# Altium schematic sheet MCU.SchDoc
size A4; SheetNumber: 3; SheetTotal: 7
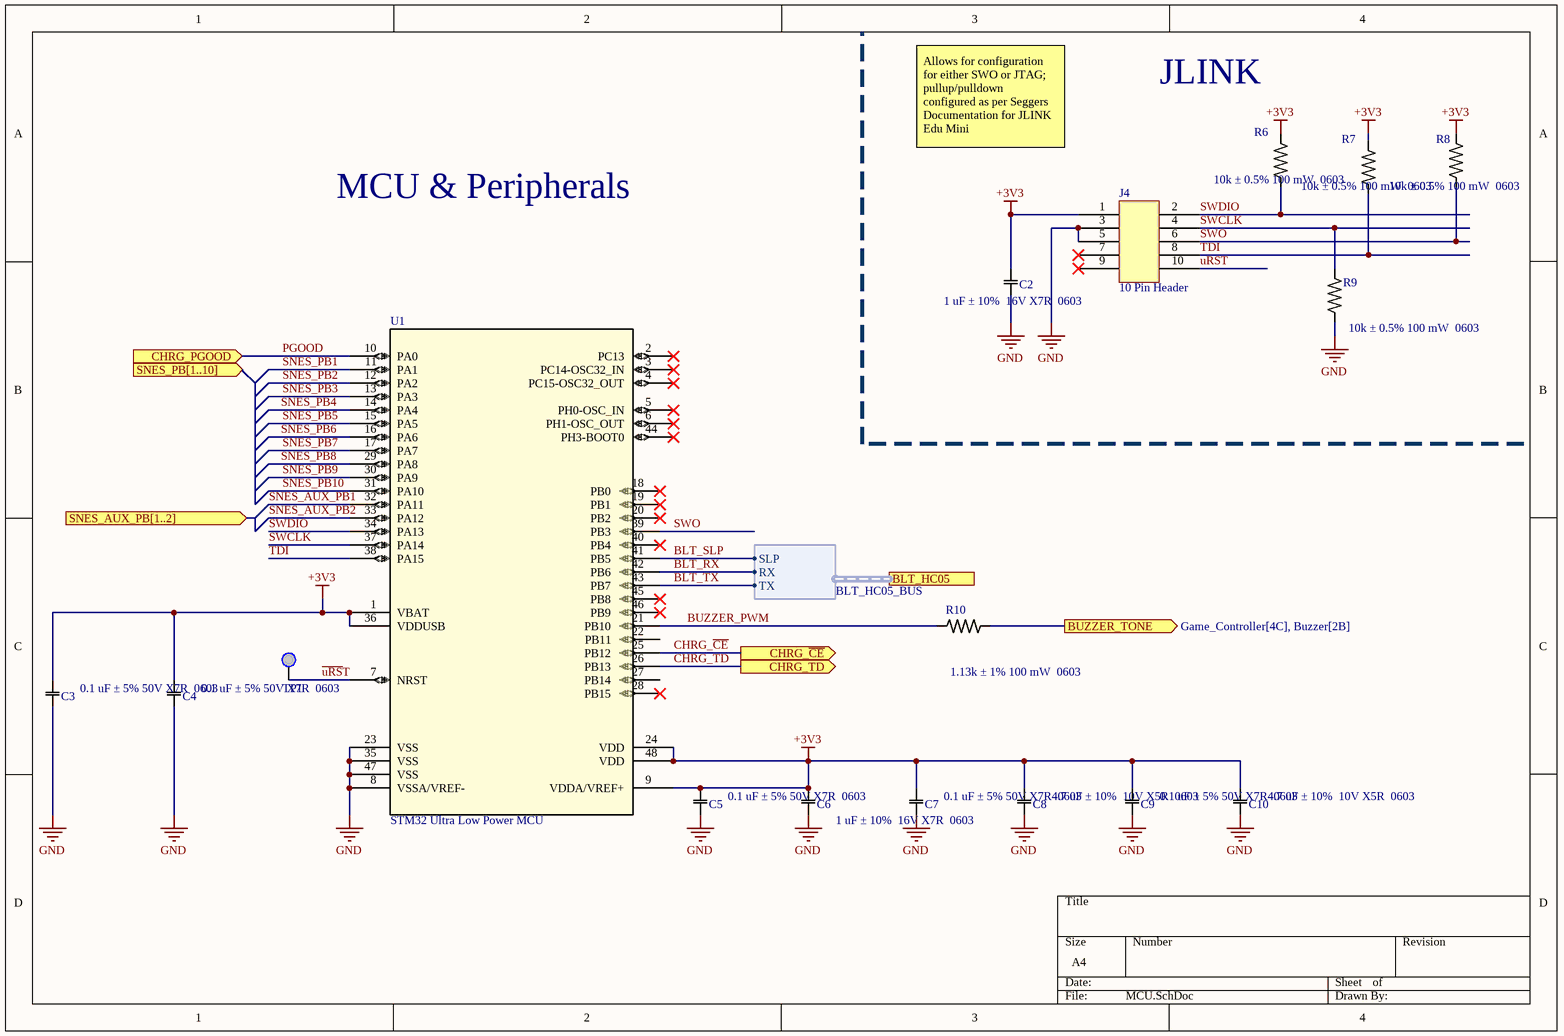
[diagram p0: MCU.SchDoc]

## Parts
C2  1 uF ± 10% / 16V X7R / 0603  [0603_CAP]
C3  0.1 uF ± 5% / 50V X7R / 0603  [0603_CAP]
C4  0.1 uF ± 5% / 50V X7R / 0603  [0603_CAP]
C5  0.1 uF ± 5% / 50V X7R / 0603  [0603_CAP]
C6  1 uF ± 10% / 16V X7R / 0603  [0603_CAP]
C7  0.1 uF ± 5% / 50V X7R / 0603  [0603_CAP]
C8  4.7 uF ± 10% / 10V X5R / 0603  [0603_CAP]
C9  0.1 uF ± 5% / 50V X7R / 0603  [0603_CAP]
C10  4.7 uF ± 10% / 10V X5R / 0603  [0603_CAP]
J4  10 Pin Header  [SHF-105-01-L-D-TH]
R6  10k ± 0.5% / 100 mW / 0603  [0603_RES]
R7  10k ± 0.5% / 100 mW / 0603  [0603_RES]
R8  10k ± 0.5% / 100 mW / 0603  [0603_RES]
R9  10k ± 0.5% / 100 mW / 0603  [0603_RES]
R10  1.13k ± 1% / 100 mW / 0603  [0603_RES]
TP1  TEST POINT  [New footprint 1]  (value not drawn)  (no BOM)
U1  STM32 Ultra Low Power MCU  [LQFP48-7x7mm]

## Ports
BLT_HC05 (harness BLT_HC05_BUS, see Game_Controller[4B], BLT[2B]), BUZZER_TONE (out, see Game_Controller[4C], Buzzer[2B]), CHRG_PGOOD (in, see Game_Controller[4C]), CHRG_TD (out, see Game_Controller[4C]), CHRG_~{CE} (out, see Game_Controller[4C]), SNES_AUX_PB[1..2] (in, see Game_Controller[4B]), SNES_PB[1..10] (in, see Game_Controller[4A])

## Harnesses
BLT_HC05_BUS: RX, TX, SLP

## Nets
+3V3: C2.1 C3.1 C4.1 C5.1 C6.1 C7.1 C8.1 C9.1 C10.1 J4.1 R6.2 R7.2 R8.2 U1.1(VBAT) U1.9(VDDA/VREF+) U1.24(VDD) U1.36(VDDUSB) U1.48(VDD)
GND: C2.2 C3.2 C4.2 C5.2 C6.2 C7.2 C8.2 C9.2 C10.2 J4.3 J4.5 R9.1 U1.8(VSSA/VREF-) U1.23(VSS) U1.35(VSS) U1.47(VSS)
~{uRS}T: J4.10 TP1.0 U1.7(NRST)
BLT_RX: U1.42(PB6) ; port BLT_HC05.RX
BLT_SLP: U1.41(PB5) ; port BLT_HC05.SLP
BLT_TX: U1.43(PB7) ; port BLT_HC05.TX
BUZZER_PWM: R10.2 U1.21(PB10)
BUZZER_TONE: R10.1 ; port BUZZER_TONE
CHRG_~{CE}: U1.25(PB12) ; port CHRG_~{CE}
CHRG_TD: U1.26(PB13) ; port CHRG_TD
PGOOD: U1.10(PA0) ; port CHRG_PGOOD
SNES_AUX_PB1: U1.32(PA11)
SNES_AUX_PB2: U1.33(PA12)
SNES_PB1: U1.11(PA1)
SNES_PB2: U1.12(PA2)
SNES_PB3: U1.13(PA3)
SNES_PB4: U1.14(PA4)
SNES_PB5: U1.15(PA5)
SNES_PB6: U1.16(PA6)
SNES_PB7: U1.17(PA7)
SNES_PB8: U1.29(PA8)
SNES_PB9: U1.30(PA9)
SNES_PB10: U1.31(PA10)
SWCLK: J4.4 R9.2 U1.37(PA14)
SWDIO: J4.2 R6.1 U1.34(PA13)
SWO: J4.6 R8.1 U1.39(PB3)
TDI: J4.8 R7.1 U1.38(PA15)

Not connected (* = marked no-connect by the designer): J4 7* 9*; U1 2(PC13)* 3(PC14-OSC32_IN)* 4(PC15-OSC32_OUT)* 5(PH0-OSC_IN)* 6(PH1-OSC_OUT)* 18(PB0)* 19(PB1)* 20(PB2)* 22(PB11) 27(PB14) 28(PB15)* 40(PB4)* 44(PH3-BOOT0)* 45(PB8)* 46(PB9)*

## Notes on the sheet
- JLINK
- Allows for configuration for either SWO or JTAG; pullup/pulldown configured as per Seggers Documentation for JLINK Edu Mini
- MCU & Peripherals

## Library data of the parts
C2 C6 = 5: Manufacturer: Yageo; Manufacturer Part Number: GXT188R71C105KE13D; CID: 5
C3-C5 C7 C9 = 3: Manufacturer: Yageo; Manufacturer Part Number: CC0603JRX7R9BB104; CID: 3
C8 C10 = 8: Manufacturer: Yageo; Manufacturer Part Number: CC0603KPX5R6BB475; CID: 8
J4 = 26: Manufacturer: Samtec; CID: 26; Manufacturer Part Number: SHF-105-01-L-D-TH
R6-R9 = 6: Manufacturer: Yageo; Manufacturer Part Number: AC0603DRE0710KL; CID: 6
R10 = 10: Manufacturer: Yageo; Manufacturer Part Number: RC0603FR-071K13L; CID: 10
TP1 = CMP-008-000007-2: 1mm Test Point
U1 = 25: Manufacturer: ST Electronics; CID: 25; Manufacturer Part Number: STM32L433CCT6